# Altium project EVLSERVO1_control_v2.PrjPcb (part 1 of 9)
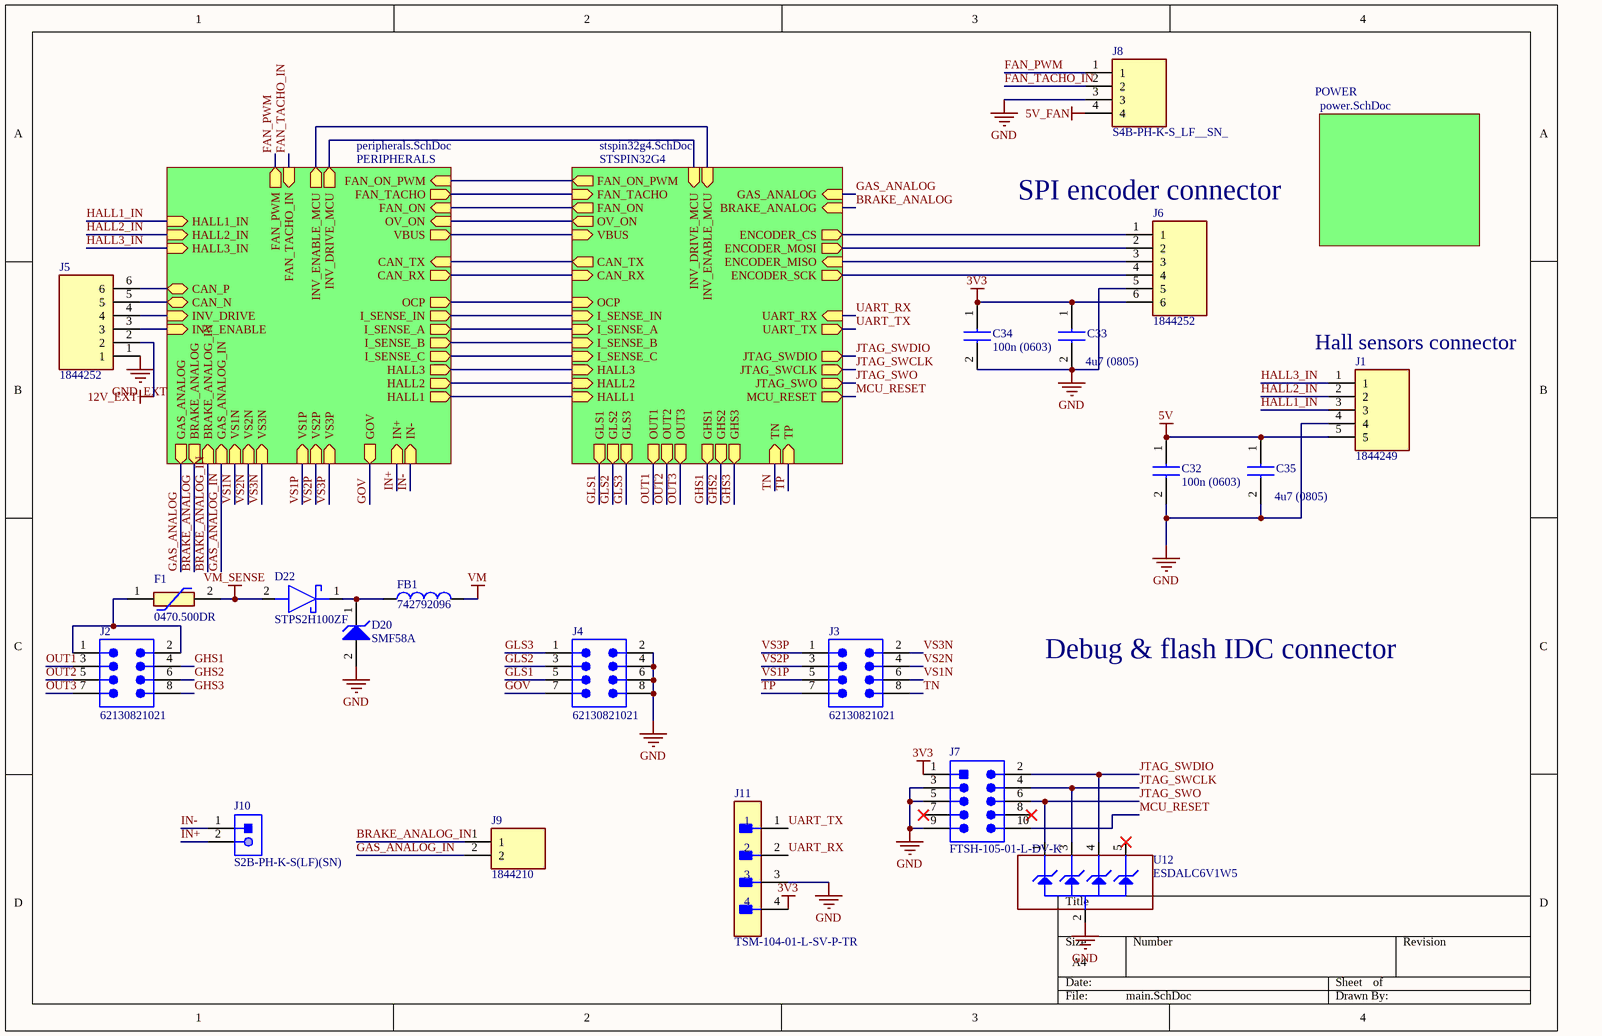
[diagram p0: main.SchDoc]
4 sheets, 223 parts. Net scope: hierarchical (ports join the sheet entries above them; power ports are global).
Board file: PCB1.PcbDoc
Sheets:
  main.SchDoc
    PERIPHERALS = peripherals.SchDoc
    POWER = power.SchDoc
    STSPIN32G4 = stspin32g4.SchDoc

## Sheet main.SchDoc
size A4; SheetNumber: 1; SheetTotal: 4

### Parts
C32  100n (0603)  [C0603]
C33  4u7 (0805)  [C0805]
C34  100n (0603)  [C0603]
C35  4u7 (0805)  [C0805]
D20  SMF58A  [ONSC-SOD-123FL-2-498_V]
D22  STPS2H100ZF  [SODFL3516X110N]
F1  0470.500DR  [1206L075132WR]
FB1  742792096  [WE-CBF_0805_L2W1.2H0.9_HC]
J1  1844249  [SHDRRA5W80P0X350_1X5_1890X920X825P]
J2  62130821021  [62130821021]
J3  62130821021  [62130821021]
J4  62130821021  [62130821021]
J5  1844252  [SHDRRA6W83P0X350_1X6_2240X920X825P]
J6  1844252  [SHDRRA6W83P0X350_1X6_2240X920X825P]
J7  FTSH-105-01-L-DV-K  [SMTC-FTSH-105-01-L-DV-K_V]
J8  S4B-PH-K-S_LF__SN_  [SHDRRA4W50P0X200_1X4_990X760X480P]
J9  1844210  [SHDRRA2W80P0X350_1X2_840X920X825P]
J10  S2B-PH-K-S(LF)(SN)  [JST-S2B-PH-K-S_V]
J11  TSM-104-01-L-SV-P-TR  [FP-TSM-104-01-L-SV-P-TR-MFG]
U12  ESDALC6V1W5  [ESDALC6V1W5]

### Sub-sheets
PERIPHERALS = peripherals.SchDoc: CAN_TX (in), CAN_RX (out), CAN_P (bidir), CAN_N (bidir), VS3N (in), VS2N (in), VS1N (in), VS1P (in), VS2P (in), VS3P (in), I_SENSE_A (out), I_SENSE_B (out), I_SENSE_C (out), I_SENSE_IN (out), OCP (out), VBUS (out), HALL1_IN (in), HALL2_IN (in), HALL3_IN (in), HALL1 (out), HALL2 (out), HALL3 (out), GOV (out), OV_ON (in), FAN_PWM (out), FAN_ON (in), FAN_ON_PWM (in), FAN_TACHO (out), FAN_TACHO_IN (in), IN- (in), IN+ (in), INV_DRIVE (in), INV_ENABLE (in), INV_DRIVE_MCU (out), INV_ENABLE_MCU (out), GAS_ANALOG (out), BRAKE_ANALOG (out), BRAKE_ANALOG_IN (in), GAS_ANALOG_IN (in)
POWER = power.SchDoc: no entries
STSPIN32G4 = stspin32g4.SchDoc: CAN_TX (out), CAN_RX (in), GHS1 (out), GHS2 (out), GHS3 (out), GLS3 (out), GLS2 (out), GLS1 (out), OUT1 (out), OUT2 (out), OUT3 (out), I_SENSE_A (in), I_SENSE_B (in), I_SENSE_C (in), OCP (in), VBUS (in), HALL3 (in), HALL2 (in), HALL1 (in), TN (in), TP (in), MCU_RESET (out), ENCODER_CS (out), ENCODER_SCK (out), ENCODER_MISO (in), ENCODER_MOSI (out), JTAG_SWDIO (out), JTAG_SWCLK (out), JTAG_SWO (out), UART_RX (in), UART_TX (out), I_SENSE_IN (in), OV_ON (out), GAS_ANALOG (in), BRAKE_ANALOG (in), FAN_ON_PWM (out), FAN_TACHO (in), FAN_ON (out), INV_DRIVE_MCU (in), INV_ENABLE_MCU (in)

### Nets
3V3: C33.1 C34.1 J6.6 J7.1 J11.4
5V: C32.1 C35.1 J1.5
5V_FAN: J8.4
12V_EXT: J5.2
GND: C32.2 C33.2 C34.2 C35.2 D20.2(A) J1.4 J4.2 J4.4 J4.6 J4.8 J6.5 J7.3 J7.5 J7.9 J8.3 J11.3 U12.2(GND)
GND_EXT: J5.1
VM: FB1.2
VM_SENSE: D22.2(A) F1.2
BRAKE_ANALOG: sheet PERIPHERALS/BRAKE_ANALOG, sheet STSPIN32G4/BRAKE_ANALOG
BRAKE_ANALOG_IN: J9.1 ; sheet PERIPHERALS/BRAKE_ANALOG_IN
CAN_N: J5.5 ; sheet PERIPHERALS/CAN_N
CAN_P: J5.6 ; sheet PERIPHERALS/CAN_P
CAN_RX: sheet PERIPHERALS/CAN_RX, sheet STSPIN32G4/CAN_RX
CAN_TX: sheet PERIPHERALS/CAN_TX, sheet STSPIN32G4/CAN_TX
ENCODER_CS: J6.1 ; sheet STSPIN32G4/ENCODER_CS
ENCODER_MISO: J6.3 ; sheet STSPIN32G4/ENCODER_MISO
ENCODER_MOSI: J6.2 ; sheet STSPIN32G4/ENCODER_MOSI
ENCODER_SCK: J6.4 ; sheet STSPIN32G4/ENCODER_SCK
FAN_ON: sheet PERIPHERALS/FAN_ON, sheet STSPIN32G4/FAN_ON
FAN_PWM: J8.1 ; sheet PERIPHERALS/FAN_PWM
FAN_PWM_ON: sheet PERIPHERALS/FAN_ON_PWM, sheet STSPIN32G4/FAN_ON_PWM
FAN_TACHO: sheet PERIPHERALS/FAN_TACHO, sheet STSPIN32G4/FAN_TACHO
FAN_TACHO_IN: J8.2 ; sheet PERIPHERALS/FAN_TACHO_IN
GAS_ANALOG: sheet PERIPHERALS/GAS_ANALOG, sheet STSPIN32G4/GAS_ANALOG
GAS_ANALOG_IN: J9.2 ; sheet PERIPHERALS/GAS_ANALOG_IN
GHS1: J2.4 ; sheet STSPIN32G4/GHS1
GHS2: J2.6 ; sheet STSPIN32G4/GHS2
GHS3: J2.8 ; sheet STSPIN32G4/GHS3
GLS1: J4.5 ; sheet STSPIN32G4/GLS1
GLS2: J4.3 ; sheet STSPIN32G4/GLS2
GLS3: J4.1 ; sheet STSPIN32G4/GLS3
GOV: J4.7 ; sheet PERIPHERALS/GOV
HALL1_IN: J1.3 ; sheet PERIPHERALS/HALL1_IN
HALL2_IN: J1.2 ; sheet PERIPHERALS/HALL2_IN
HALL3_IN: J1.1 ; sheet PERIPHERALS/HALL3_IN
I_SENSE_A: sheet PERIPHERALS/I_SENSE_A, sheet STSPIN32G4/I_SENSE_A
I_SENSE_B: sheet PERIPHERALS/I_SENSE_B, sheet STSPIN32G4/I_SENSE_B
I_SENSE_C: sheet PERIPHERALS/I_SENSE_C, sheet STSPIN32G4/I_SENSE_C
IN+: J10.2 ; sheet PERIPHERALS/IN+  [project net IIN+]
IN-: J10.1 ; sheet PERIPHERALS/IN-  [project net IIN-]
INV_DRIVE_MCU: sheet PERIPHERALS/INV_DRIVE_MCU, sheet STSPIN32G4/INV_DRIVE_MCU
INV_ENABLE_MCU: sheet PERIPHERALS/INV_ENABLE_MCU, sheet STSPIN32G4/INV_ENABLE_MCU
JTAG_SWCLK: J7.4 U12.3(IO2) ; sheet STSPIN32G4/JTAG_SWCLK
JTAG_SWDIO: J7.2 U12.4(IO3) ; sheet STSPIN32G4/JTAG_SWDIO
JTAG_SWO: J7.6 U12.1(IO1) ; sheet STSPIN32G4/JTAG_SWO
MCU_RESET: J7.10 ; sheet STSPIN32G4/MCU_RESET
OCP: sheet PERIPHERALS/OCP, sheet STSPIN32G4/OCP
OUT1: J2.3 ; sheet STSPIN32G4/OUT1
OUT2: J2.5 ; sheet STSPIN32G4/OUT2
OUT3: J2.7 ; sheet STSPIN32G4/OUT3
OV_ON: sheet PERIPHERALS/OV_ON, sheet STSPIN32G4/OV_ON
TN: J3.8 ; sheet STSPIN32G4/TN  [project net NTC]
TP: J3.7 ; sheet STSPIN32G4/TP
UART_RX: J11.2 ; sheet STSPIN32G4/UART_RX
UART_TX: J11.1 ; sheet STSPIN32G4/UART_TX
VBUS: sheet PERIPHERALS/VBUS, sheet STSPIN32G4/VBUS
VS1N: J3.6 ; sheet PERIPHERALS/VS1N
VS1P: J3.5 ; sheet PERIPHERALS/VS1P
VS2N: J3.4 ; sheet PERIPHERALS/VS2N
VS2P: J3.3 ; sheet PERIPHERALS/VS2P
VS3N: J3.2 ; sheet PERIPHERALS/VS3N
VS3P: J3.1 ; sheet PERIPHERALS/VS3P
NetC29_2: sheet PERIPHERALS/I_SENSE_IN, sheet STSPIN32G4/I_SENSE_IN
NetC42_2: sheet PERIPHERALS/HALL1, sheet STSPIN32G4/HALL1
NetC43_2: sheet PERIPHERALS/HALL2, sheet STSPIN32G4/HALL2
NetC44_2: sheet PERIPHERALS/HALL3, sheet STSPIN32G4/HALL3
NetD20_1: D20.1(K) D22.1(K) FB1.1
NetF1_1: F1.1 J2.1 J2.2
NetJ5_3: J5.3 ; sheet PERIPHERALS/INV_ENABLE
NetJ5_4: J5.4 ; sheet PERIPHERALS/INV_DRIVE

Not connected (* = marked no-connect by the designer): J7 7* 8*; U12 5(IO4)*

### Notes on the sheet
- (near J6) SPI encoder connector
- (near J1) Hall sensors connector
- Debug & flash IDC connector

### Library data of the parts
C32 C34 = GCM188R71E104JA57D: CAP CER 0.1UF 25V X7R 0603 / 0.1 μF ±5% 25V Ceramic Capacitor X7R 0603 (1608 Metric); Manufacturer_Name: Murata Electronics; Manufacturer: Murata; Manufacturer Lifecycle Status: NRND; Value: 100nF; Datasheet Link: https://search.murata.co.jp/Ceramy/image/img/A01X/G101/ENG/GCM188R71E104JA57-01A.pdf; Height: 0.9mm; Manufacturer_Part_Number: GCM188R71E104JA57D; Mouser Part Number: 81-GCM188R71E104JAD; Mouser Price/Stock: https://www.mouser.co.uk/ProductDetail/Murata-Electronics/GCM188R71E104JA57D?qs=ui%252B2d9lVEI5lLkZDVYlCng%3D%3D; Arrow Part Number: GCM188R71E104JA57D; Arrow Price/Stock: https://www.arrow.com/en/products/gcm188r71e104ja57d/murata-manufacturing; Supplier: DigiKey; Supplier Part Number: 490-GCM188R71E104JA57DCT-ND; Manufacturer Part Number: GCM188R71E104JA57D; RoHS: Compliant; Category: Ceramic Capacitors; Stock: 2875; Pricing: 1=0,33, 10=0,196, 50=0,1434, 100=0,1272, 500=0,09986, 1000=0,09143 (USD); Case/Package: 0603; Country of Origin: Philippines; Dielectric Material: Ceramic; Export Control Classification Number (ECCN) Code: EAR99; Harmonized Tariff Schedule (HTS) Code: 8532.24.00.20; Introduction Date: 2013-11-20; Length: 1.6mm; Lifecycle Status: NRND; Max Operating Temperature: 125°C; Min Operating Temperature: -55°C; Mounting Technology: Surface Mount; Number of Terminals: 2; Ratings: AEC-Q200; REACH SVHC: Yes; Schedule B: 8532240020, 8532240020|8532240020|8532240020|8532240020|8532240020; Thickness: 800µm; Voltage Rating (DC): 25V; Width: 800µm; ComponentLink1URL: https://datasheet.octopart.com:443/GCM188R71E104JA57D-Murata-datasheet-141267551.pdf?src-supplier=Geoflip; ComponentLink1Description: https://datasheet.octopart.com:443/GCM188R71E104JA57D-Murata-datasheet-141267551.pdf?src-supplier=Geoflip; ComponentLink2URL: https://datasheet.octopart.com:443/GCM188R71E104JA57D-Murata-datasheet-140658663.pdf?src-supplier=Ciiva; ComponentLink2Description: https://datasheet.octopart.com:443/GCM188R71E104JA57D-Murata-datasheet-140658663.pdf?src-supplier=Ciiva; ComponentLink3URL: https://datasheet.octopart.com:443/GCM188R71E104JA57D-Murata-datasheet-138718229.pdf?src-supplier=Ciiva; ComponentLink3Description: https://datasheet.octopart.com:443/GCM188R71E104JA57D-Murata-datasheet-138718229.pdf?src-supplier=Ciiva; ComponentLink4URL: http://sigma.octopart.com:80/reach_statement/Murata-company-16.pdf?src-supplier=Compliance+Statements; ComponentLink4Description: http://sigma.octopart.com:80/reach_statement/Murata-company-16.pdf?src-supplier=Compliance+Statements
C33 C35 = GRM21BZ71E475KE15L: 25V 4.7uF X7R ±10% 0805 Multilayer Ceramic Capacitors MLCC - SMD/SMT ROHS; Manufacturer_Name: Murata Electronics; Manufacturer: Murata; Manufacturer Lifecycle Status: IN PRODUCTION; Value: 4.7µF; Datasheet Link: https://search.murata.co.jp/Ceramy/image/img/A01X/G101/ENG/GRM21BZ71E475KE15-01A.pdf; Height: 1.45mm; Manufacturer_Part_Number: GRM21BZ71E475KE15L; Mouser Part Number: 81-GRM21BZ71E475KE5L; Mouser Price/Stock: https://www.mouser.co.uk/ProductDetail/Murata-Electronics/GRM21BZ71E475KE15L?qs=Ey7%2FXF42M3feXnDNgc%252BFlQ%3D%3D; Arrow Part Number: GRM21BZ71E475KE15L; Arrow Price/Stock: https://www.arrow.com/en/products/grm21bz71e475ke15l/murata-manufacturing?utm_currency=USD&region=nac; Supplier: RS; Supplier Part Number: 2478136; Manufacturer Part Number: GRM21BZ71E475KE15L; RoHS: Compliant; Category: Ceramic Capacitors; Stock: 4700; Case/Package: 0805; Dielectric Material: Ceramic; Export Control Classification Number (ECCN) Code: EAR99; Harmonized Tariff Schedule (HTS) Code: 8532.24.00.20; Introduction Date: 2017-02-22; Length: 2mm; Lifecycle Status: Production; Material: Ceramic; Max Operating Temperature: 125°C; Min Operating Temperature: -55°C; Mounting Technology: Surface Mount; Number of Terminals: 2; REACH SVHC: Yes; Thickness: 1.25mm; Tolerance: 10%; Voltage Rating: 25V; Voltage Rating (DC): 25V; Width: 1.25mm; ComponentLink1URL: https://datasheet.octopart.com:443/GRM21BZ71E475KE15L-Murata-datasheet-155345087.pdf?src-supplier=Newark; ComponentLink1Description: https://datasheet.octopart.com:443/GRM21BZ71E475KE15L-Murata-datasheet-155345087.pdf?src-supplier=Newark; ComponentLink2URL: https://datasheet.octopart.com:443/GRM21BZ71E475KE15L-Murata-datasheet-141278877.pdf?src-supplier=Geoflip; ComponentLink2Description: https://datasheet.octopart.com:443/GRM21BZ71E475KE15L-Murata-datasheet-141278877.pdf?src-supplier=Geoflip; ComponentLink3URL: https://datasheet.octopart.com:443/GRM21BZ71E475KE15L-Murata-datasheet-165579666.pdf?src-supplier=TME; ComponentLink3Description: https://datasheet.octopart.com:443/GRM21BZ71E475KE15L-Murata-datasheet-165579666.pdf?src-supplier=TME; ComponentLink4URL: https://datasheet.octopart.com:443/GRM21BZ71E475KE15L-Murata-datasheet-140707839.pdf?src-supplier=Ciiva; ComponentLink4Description: https://datasheet.octopart.com:443/GRM21BZ71E475KE15L-Murata-datasheet-140707839.pdf?src-supplier=Ciiva; ComponentLink5URL: https://datasheet.octopart.com:443/GRM21BZ71E475KE15L-Murata-datasheet-138745135.pdf?src-supplier=Ciiva; ComponentLink5Description: https://datasheet.octopart.com:443/GRM21BZ71E475KE15L-Murata-datasheet-138745135.pdf?src-supplier=Ciiva; ComponentLink6URL: http://sigma.octopart.com:80/reach_statement/Murata-company-16.pdf?src-supplier=Compliance+Statements; ComponentLink6Description: http://sigma.octopart.com:80/reach_statement/Murata-company-16.pdf?src-supplier=Compliance+Statements
D20 = CMP-1061-00608-1: 200 W Transient Voltage Suppressor, 2-Pin SOD-123FL, Pb-Free, Tape and Reel; Manufacturer: On Semiconductor; PartNumber: SMF58AT1G; Direction: Unidirectional; IR Max (uA): 1; V(BR) Typ (V): 67.8; ComponentLink2URL: http://www.onsemi.com/pub_link/Collateral/SMF5.0AT1-D.PDF; Packing: Tape and Reel; DatasheetVersion: Rev. 7; PackageReference: SOD-123FL-2-498; ComponentLink2Description: Datasheet; RoHS: Pb-Free; ComponentLink3Description: Package Specification; PackageVersion: Rev. D, 05/2013; ComponentLink1URL: http://www.onsemi.com/; ComponentLink3URL: http://www.onsemi.com/pub_link/Collateral/498-01.PDF; PackageDescription: 2-Pin SOD, Body 1.65 x 2.7 mm; Mounting Technology: Surface Mount; ComponentLink1Description: Manufacturer URL
D22 = STPS2H100ZF: Schottky Diode; Manufacturer_Name: STMicroelectronics; Datasheet Link: https://www.st.com/resource/en/datasheet/stps2h100zf.pdf; Height: 1.1mm; Manufacturer_Part_Number: STPS2H100ZF; Mouser Part Number: 511-STPS2H100ZF; Mouser Price/Stock: https://www.mouser.co.uk/ProductDetail/STMicroelectronics/STPS2H100ZF?qs=BAoXHaCe4Em%2FfzC%252BFY2Wew%3D%3D; Arrow Part Number: STPS2H100ZF; Arrow Price/Stock: https://www.arrow.com/en/products/stps2h100zf/stmicroelectronics?utm_currency=USD&region=nac
F1 = 1206L110_16WR: Resettable Fuse; Manufacturer_Name: LITTELFUSE; Manufacturer_Part_Number: 1206L110/16WR; Datasheet Link: https://www.littelfuse.com/~/media/electronics/datasheets/resettable_ptcs/littelfuse_ptc_1206l_datasheet.pdf.pdf; Height: 1.25mm; Mouser Part Number: 576-1206L110/16WR; Mouser Price/Stock: https://www.mouser.co.uk/ProductDetail/Littelfuse/1206L110-16WR?qs=TVaBpCI%2FeOi62RF5AFEWSA%3D%3D; Arrow Part Number: 1206L110/16WR; Arrow Price/Stock: https://www.arrow.com/en/products/1206l11016wr/littelfuse?utm_currency=USD&region=nac
FB1 = CMP-0220-00166-2: NexarPartId: 8916991; Impedance: 1kΩ; Inductance: 2.2H; Current Rating: 1A; Tolerance: 25%; Resistance: 300mΩ; Number of Lines: 1; Test Frequency: 100MHz; Termination: SMD/SMT; REACH SVHC: Unknown; Depth: 1.2mm; Case Code (Imperial): 0805; Case/Package: SMD/SMT; RoHS: Compliant; Material: Ferrite; Max Current Rating: 1A; Width: 1.2mm; Packaging: Digi-Reel®; Lead Free: Lead Free; Height: 900µm; Core Material: Ferrite; Weight: 5.499807mg; Max DC Current: 1A; Min Operating Temperature: -55°C; Max Operating Temperature: 125°C; Mount: Surface Mount; Length: 2mm; Case Code (Metric): 2012; DC Resistance (DCR): 300mΩ
J1 = 1844249: Connector; Manufacturer_Name: Phoenix Contact; Datasheet Link: https://www.phoenixcontact.com/en-us/products/pcb-header-mc-15-5-g-35-1844249?type=pdf; Height: 8.25mm; Manufacturer_Part_Number: 1844249; Mouser Part Number: 651-1844249; Mouser Price/Stock: https://www.mouser.co.uk/ProductDetail/Phoenix-Contact/1844249?qs=wd%252Bw3mUqFrkyoPkI2iC2Lg%3D%3D; Arrow Part Number: 1844249; Arrow Price/Stock: https://www.arrow.com/en/products/1844249/phoenix-contact.html?utm_currency=USD&region=nac
J2-J4 = CMP-03913-122375878-3: Conn, Header, 8Pos, 2Row, 1.27Mm Rohs Compliant: Yes; Current Rating: 1A; Number of Contacts: 8; Voltage Rating: 100V; Max Operating Temperature: 105°C; Number of Rows: 2; RoHS: Compliant; Contact Material: Gold; Height: 6.4mm; Min Operating Temperature: -40°C
J5 J6 = 1844252: Connector; Manufacturer_Name: Phoenix Contact; Datasheet Link: https://www.phoenixcontact.com/en-us/products/pcb-header-mc-15-6-g-35-1844252?type=pdf; Height: 8.25mm; Manufacturer_Part_Number: 1844252; Mouser Part Number: 651-1844252; Mouser Price/Stock: https://www.mouser.co.uk/ProductDetail/Phoenix-Contact/1844252?qs=8BCRtFWWXOQ9wOLoIUfCgg%3D%3D; Arrow Part Number: 1844252; Arrow Price/Stock: https://www.arrow.com/en/products/1844252/phoenix-contact?utm_currency=USD&region=nac
J7 = CMP-2000-05353-1: Male Header, Pitch 1.27 mm, 2 x 5 Position, Height 6.25 mm; Manufacturer: Samtec; Pitch: 0.050"(1.27mm); Other Names: Q3937619; Number of Positions: 10; Mating Products: SFMC-105-L2-S-D-TR-ND / -CONN.05"SURFACE10POSSMT / FLE-105-01-G-DV-TR-ND / -CONNSKT1.27MM10POSDUALSMD / FLE-105-01-G-DV-A-P-ND / -CONNSKT1.27MM10POSDUALSMD / FLE-105-01-G-DV-A-ND / -CONNSKT1.27MM10POSDUALSMD / CLP-105-02-G-D-P-TR-ND / -CONNRCPT10POSDUAL.05"SMD / SAM1155-05-ND / -CONNRCPT10POSDUAL.05"SMD / SAM1154-05-ND / -CONNRCPT10POSDUAL.05"SMD / SAM1153-05-ND / -CONNRCPT10POSDUAL.05"SMD / SAM1226-05-ND / -CONNRCPT.05"10POSDUALSMD; Number of Positions Loaded: All; Connector Type: Header,Unshrouded; Product Training Modules: Board-to-BoardConnectors; Datasheet Version: Rev. ET, 10/1995; Number of Rows: 2; Standard Package: 1; Package Description: Male Header, Pitch 1.27 mm, 2 x 5 Position, Height 5.97 mm, Tail Length 4.32 mm; Contact Finish Thickness: 10µin(0.25µm); Series: FTSH; Termination: Solder; Contact Type: MalePin; Color: Black; Package Reference: FTSH-105-01-L-DV-K; Family: RectangularConnectors-Headers,MalePins; Package URL: http://suddendocs.samtec.com/prints/ftsh-1xx-xx-xxx-dv-xxx-footprint.pdf; Packaging: Tube; Mounting Type: SurfaceMount; Category: Connectors,Interconnects; Datasheet URL: http://suddendocs.samtec.com/prints/ftsh-1xx-xx-xxx-dv-xxx-mkt.pdf; Row Spacing: 0.050"(1.27mm); Manufacturer URL: http://www.samtec.com/; Contact Mating Length: 0.120"(3.05mm); Contact Finish: Gold
J8 = S4B-PH-K-S_LF__SN_: Connector; Manufacturer_Name: JST (JAPAN SOLDERLESS TERMINALS); Manufacturer_Part_Number: S4B-PH-K-S(LF)(SN); Datasheet Link: https://datasheet.lcsc.com/szlcsc/JST-Sales-America-PHsocket-1-4P-Curved-needle-pitch2mm_C157926.pdf; Height: 4.8mm; Mouser Part Number: N/A; Mouser Price/Stock: https://www.mouser.co.uk/ProductDetail/JST-Commercial/S4B-PH-K-SLFSN?qs=QpmGXVUTftEGA16rwNx4xw%3D%3D; Arrow Part Number: S4B-PH-K-S(LF)(SN); Arrow Price/Stock: https://www.arrow.com/en/products/s4b-ph-k-s-lf-sn/jst-manufacturing.html?utm_currency=USD&region=europe
J9 = 1844210: Connector; Manufacturer_Name: Phoenix Contact; Datasheet Link: https://www.phoenixcontact.com/en-us/products/pcb-header-mc-15-2-g-35-1844210?type=pdf; Height: 8.25mm; Manufacturer_Part_Number: 1844210; Mouser Part Number: 651-1844210; Mouser Price/Stock: https://www.mouser.co.uk/ProductDetail/Phoenix-Contact/1844210?qs=8BCRtFWWXORb3OQRdxIGVQ%3D%3D; Arrow Part Number: 1844210; Arrow Price/Stock: https://www.arrow.com/en/products/1844210/phoenix-contact?utm_currency=USD&region=nac
J10 = CMP-1755-00004-1: Male Header, Pitch 2 mm, 1 x 2 Position, Height 4.8 mm, Tail Length 3.4 mm, -25 to 85 degC, RoHS, Bulk; Case\Package: Radial; Tolerance: 20%; Capacitance: 10 uF; Voltage Rating (DC): 50 V; Packaging: Bulk; ComponentLink1URL: http://www.jst-mfg.com/product/pdf/eng/ePH.pdf; Radiation Hardening: No; Height: 11 mm; Package Quantity: 200; PackageDescription: Male Header, Pitch 2 mm, 1 x 2 Position, Height 4.8 mm, Tail Length 3.4 mm; PackageReference: S2B-PH-K-S; Diameter: 5 mm; Pins: 2; Mount: Through Hole; Max Operating Temperature: 85 degC; Min Operating Temperature: -40 degC; ComponentLink1Description: Datasheet; DatasheetVersion: Dec-12; Length: 11 mm; Lead Pitch: 2 mm; REACH SVHC: No SVHC; Voltage Rating: 50 V; RoHSCompliant: true
J11 = CMP-02766-000011-1: CONN HEADER SMD 4POS 2.54MM; Manufacturer: Samtec; Number Of Contacts: 4; Conn Gender: Male; Standoff Height: 0.04inch; Conn Orientation: Vertical; Current Rating: 5.4A; Voltage Rating: 475V; Manufacturer Part Number: TSM-104-01-L-SV-P-TR; Contact Material: Gold,Nickel; RoHS: TRUE; ComponentLink2URL: http://suddendocs.samtec.com/prints/tsm-1xx-xx-xxx-sv-xx-xxx-xx-mkt.pdf; Package: TSM-104-01-L-SV-P-TR; Lead Free: Yes; Automotive: No; Category: Conn; Digikey Description: CONN HEADER SMD 4POS 2.54MM; ComponentLink2Description: Datasheet; Temperature: -55°C to +125°C; Height: 0.403inch; Device Class L1: Connectors; Device Class L3: unset; Octopart: https://octopart.com/tsm-104-01-l-sv-p-tr-samtec-6805355; Pitch: 2.54mm; Footprint Url: http://suddendocs.samtec.com/prints/tsm-1xx-xx-xx-sv-xx-xxx-xx-footprint.pdf; Device Class L2: Headers and Wire Housings; Temperature Range Low: -55°C; Number Of Rows: 1; Temperature Range High: +125°C
U12 = ESDALC6V1W5: Dual Transil array for ESD protection; Internal_Part_Number: MCD-00136; Part_Type: Diode; Manufacturer: STMICROELECTRONICS; ECCN_US: EAR99; ECCN_EU: NEC; Provided_By: Subcon; Initial_Board_Reference: MB1262; Status: Released; Manufacturer_Part_Number: ESDALC6V1W5; ComponentLink1Description: STM_ESD_ESDALC6V1W5.pdf; ComponentLink1URL: http://tunmcdsvn.tun.st.com/Component_Datasheet_Library/Trunk/Diodes/STM_ESD_ESDALC6V1W5; Value: ESDALC6V1W5

## Sheet peripherals.SchDoc
size A2; SheetNumber: 3; SheetTotal: 4
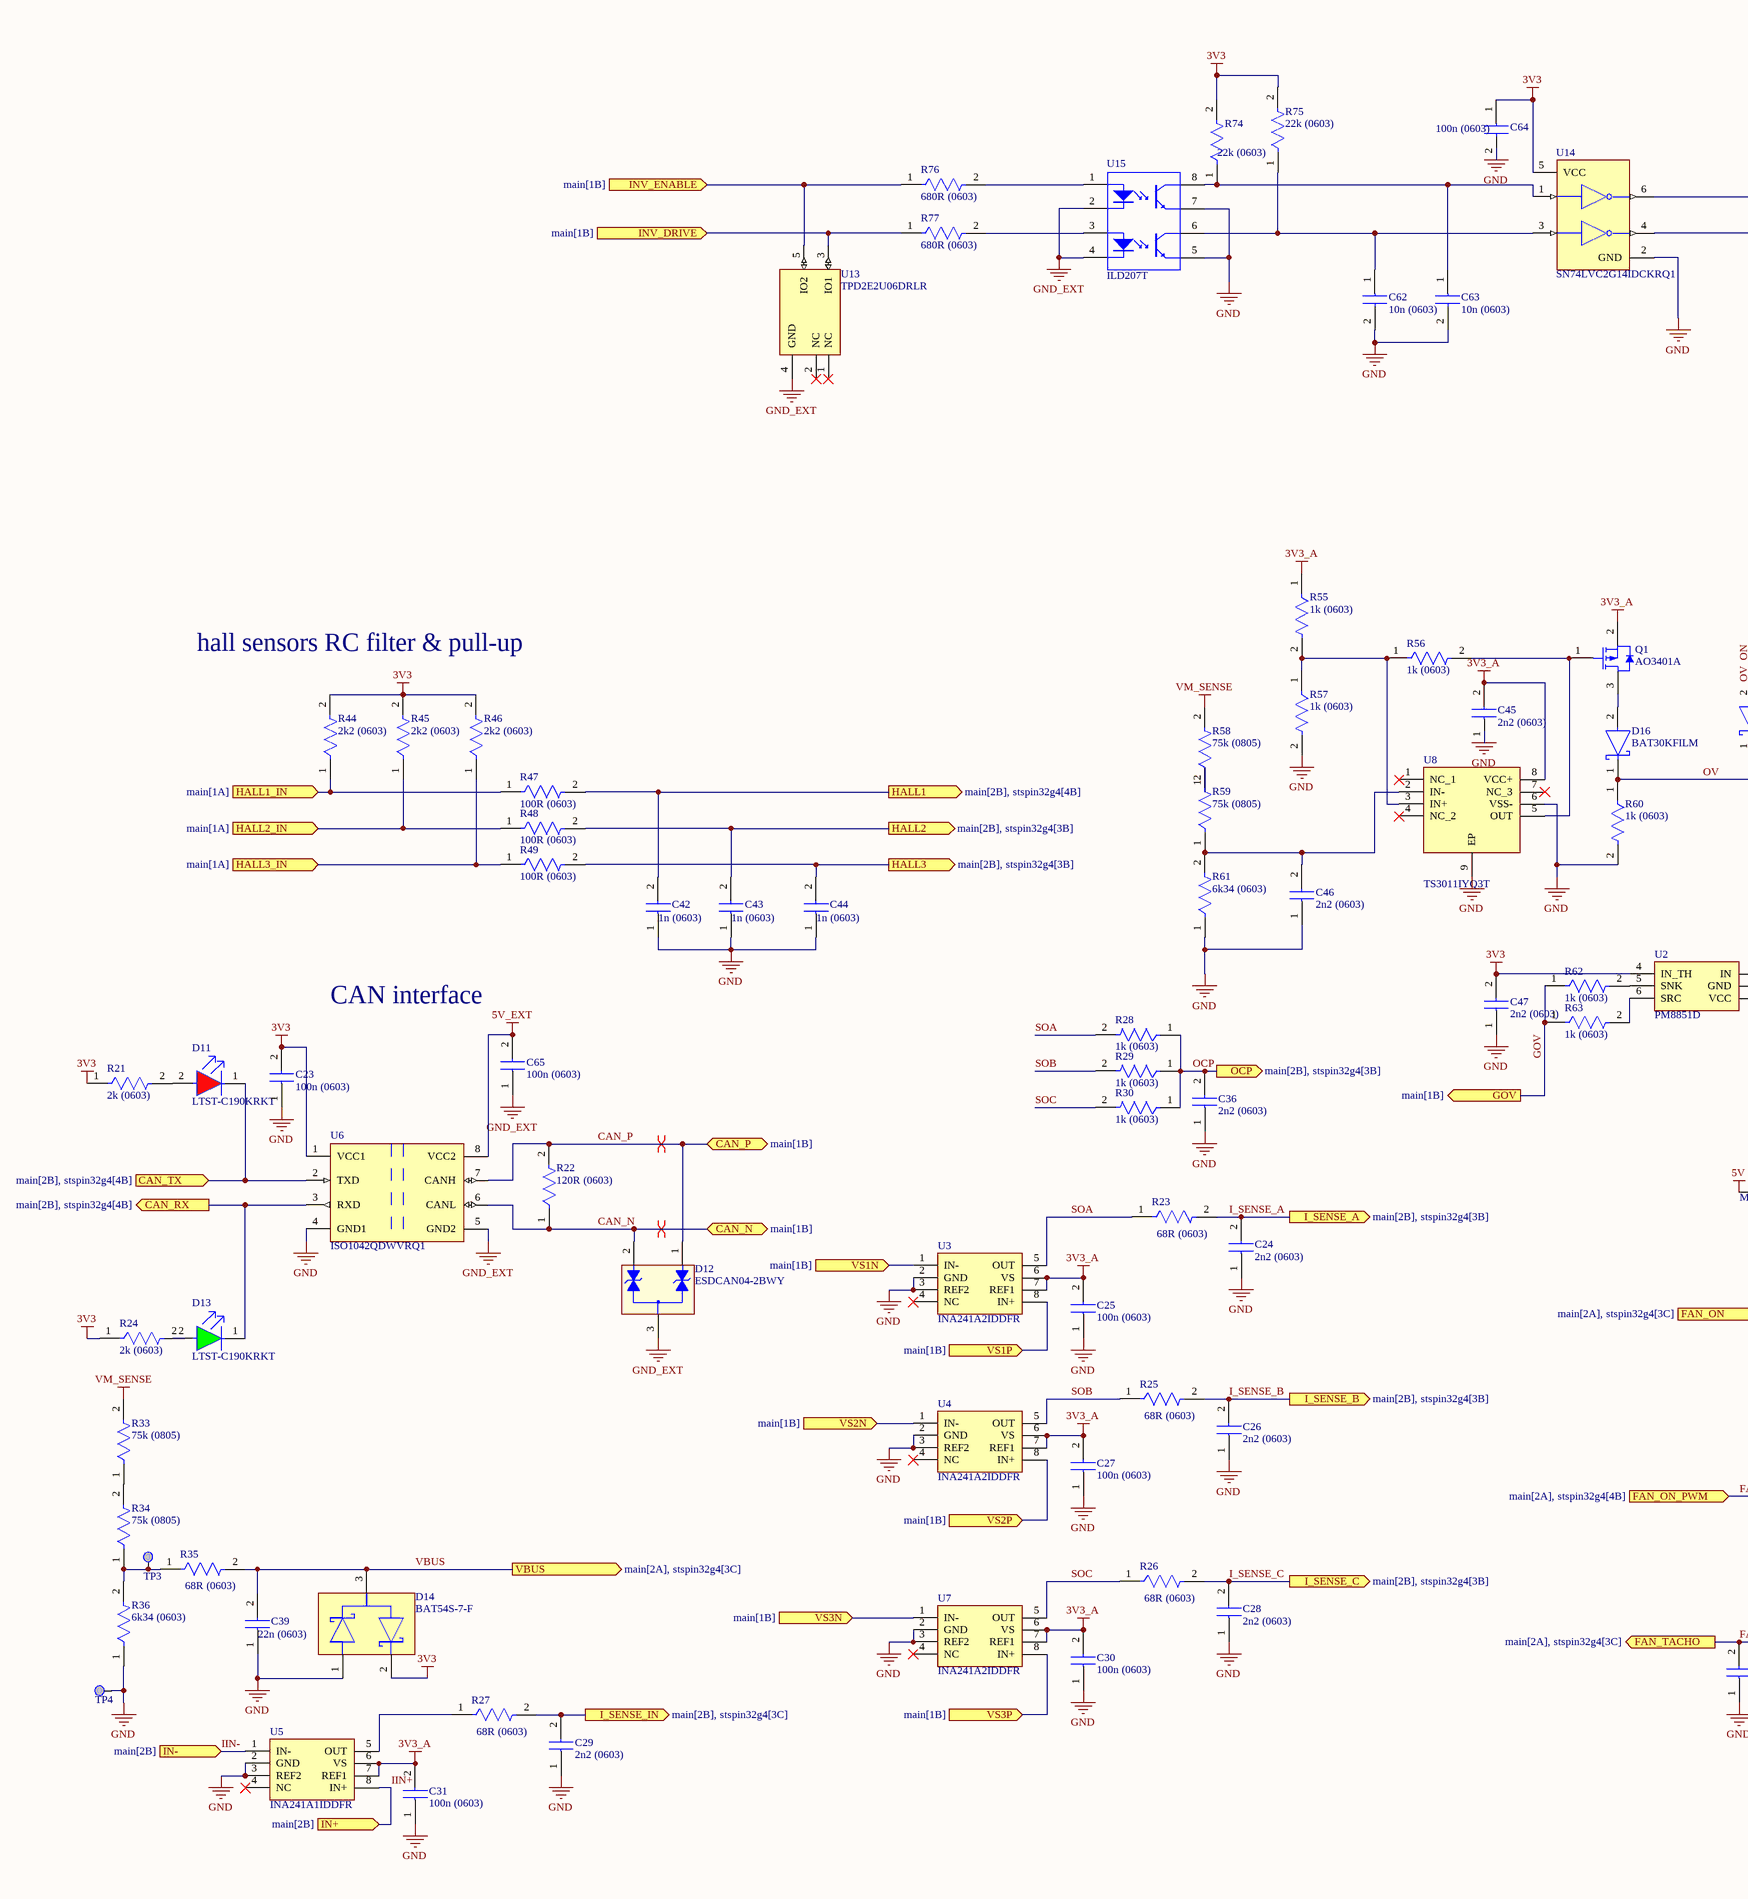
[diagram p1: peripherals.SchDoc, left]
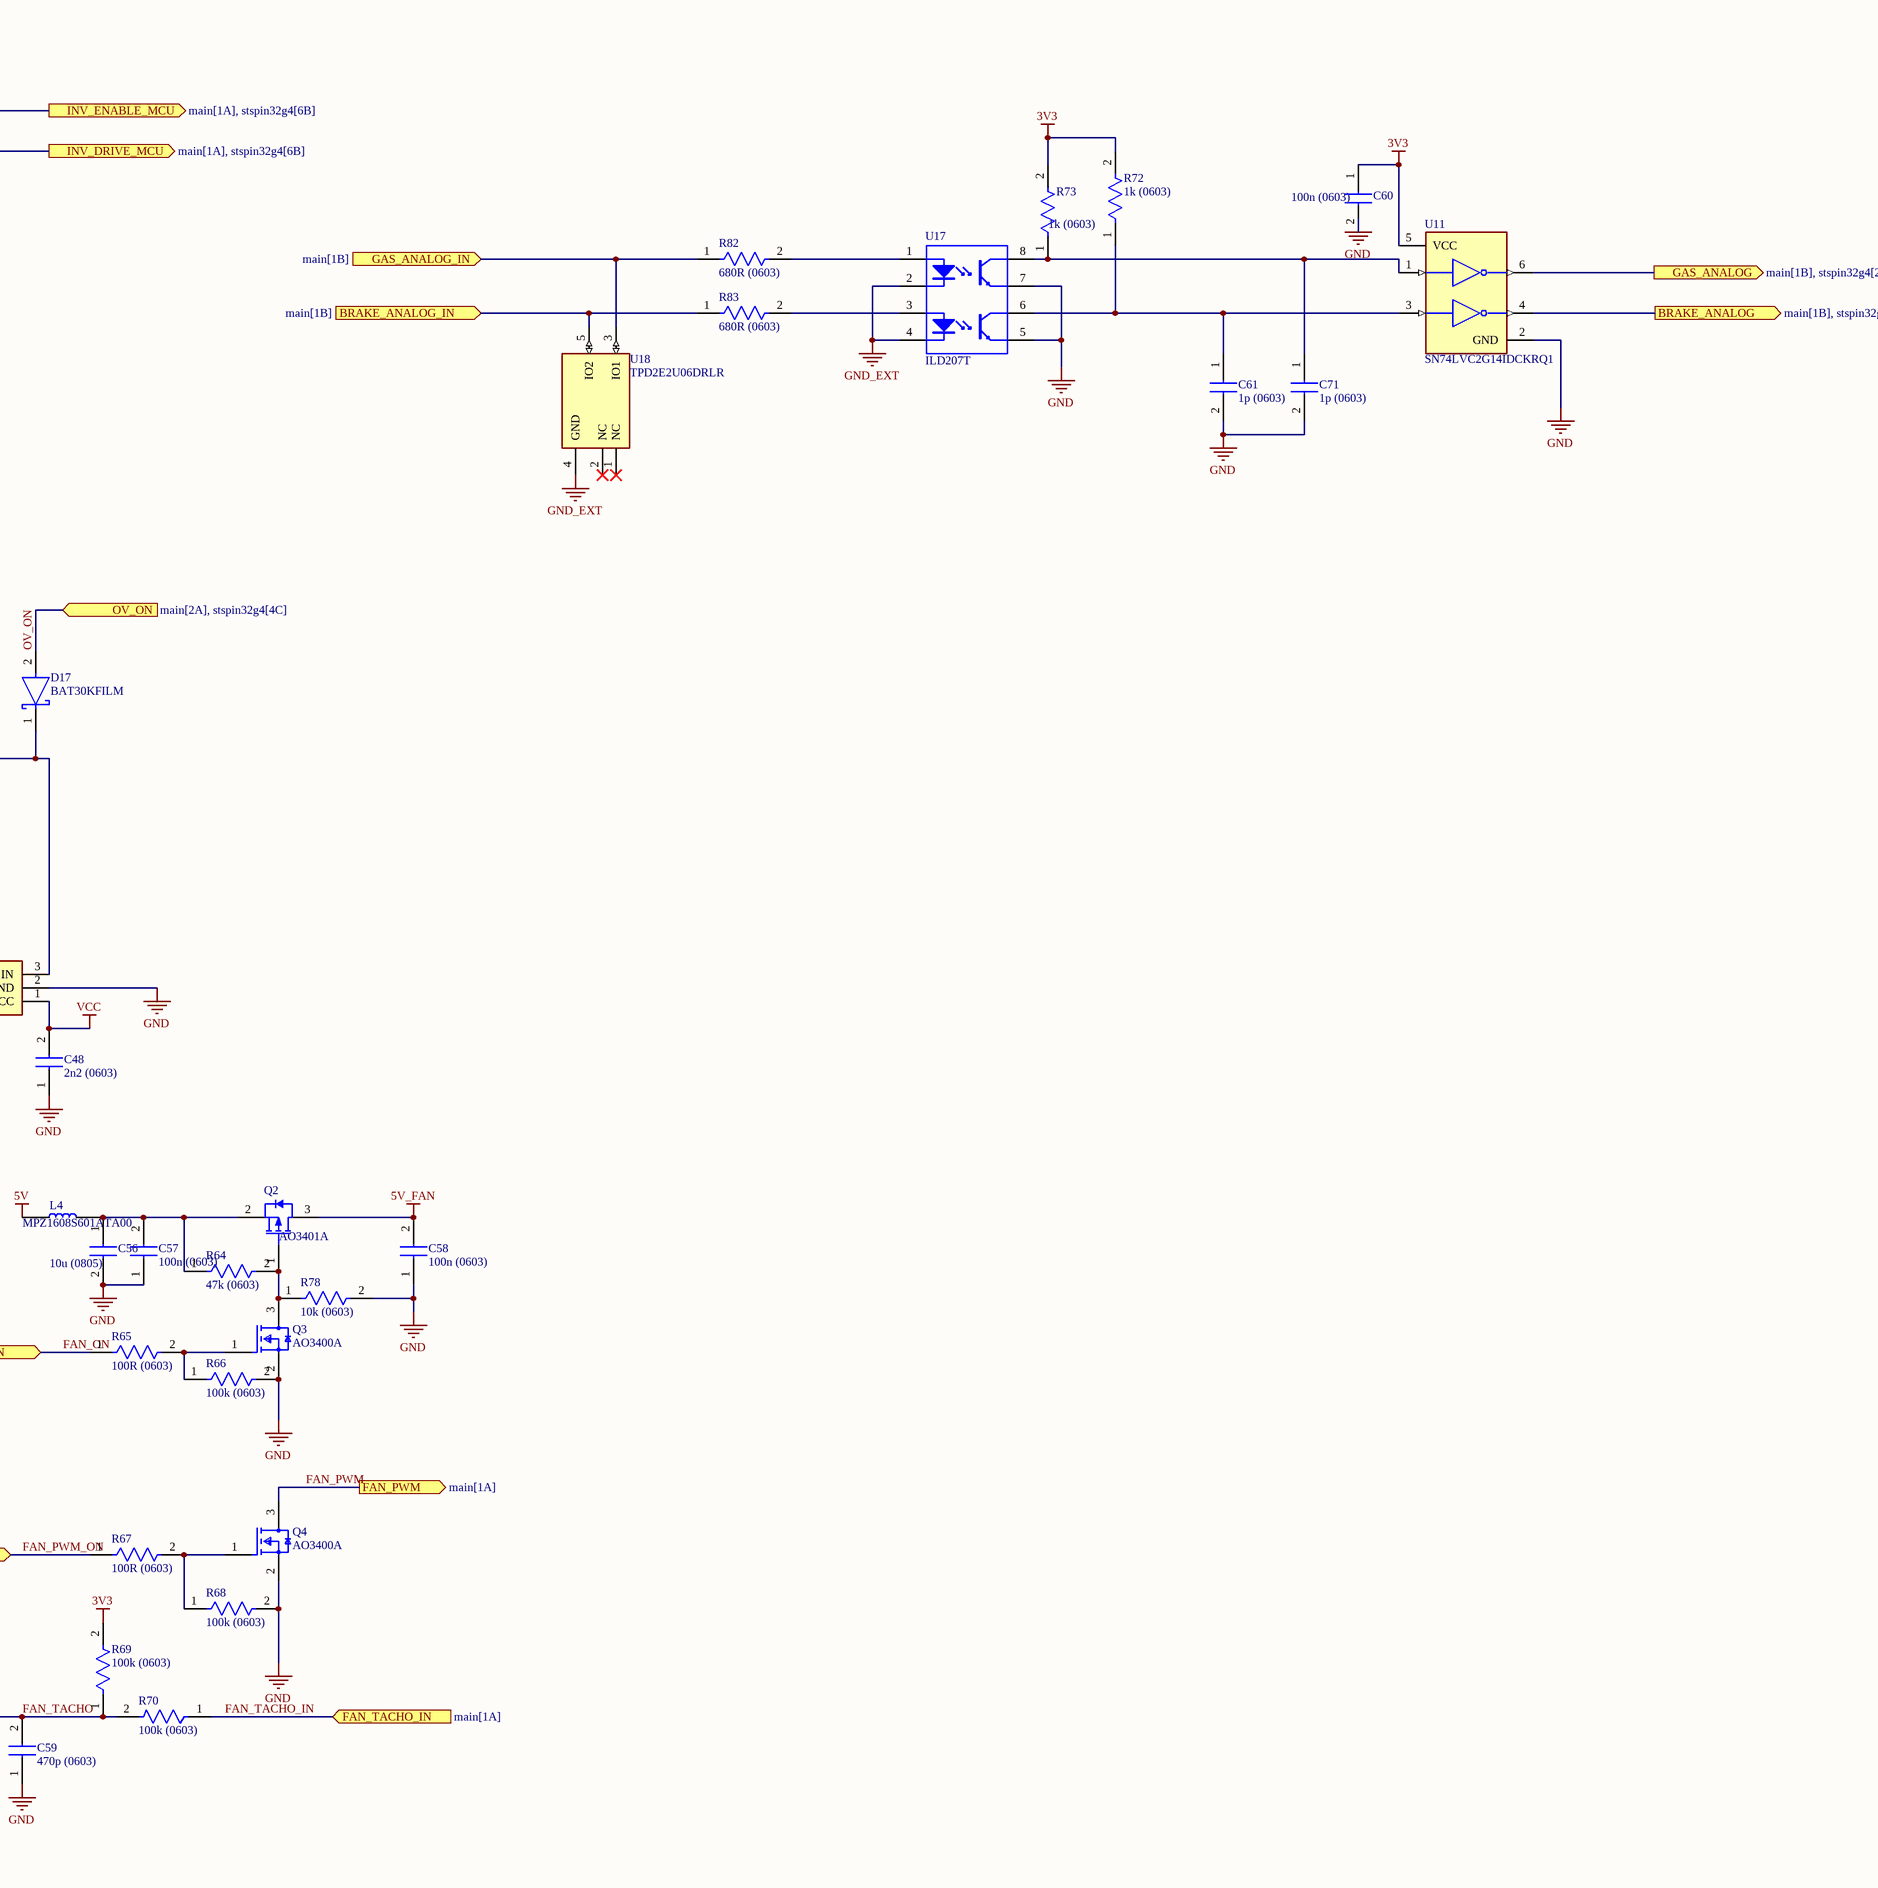
[diagram p2: peripherals.SchDoc, right]

### Parts
C23  100n (0603)  [C0603]
C24  2n2 (0603)  [C0603]
C25  100n (0603)  [C0603]
C26  2n2 (0603)  [C0603]
C27  100n (0603)  [C0603]
C28  2n2 (0603)  [C0603]
C29  2n2 (0603)  [C0603]
C30  100n (0603)  [C0603]
C31  100n (0603)  [C0603]
C36  2n2 (0603)  [C0603]
C39  22n (0603)  [C0603]
C42  1n (0603)  [C0603]
C43  1n (0603)  [C0603]
C44  1n (0603)  [C0603]
C45  2n2 (0603)  [C0603]
C46  2n2 (0603)  [C0603]
C47  2n2 (0603)  [C0603]
C48  2n2 (0603)  [C0603]
C56  10u (0805)  [C0805]
C57  100n (0603)  [C0603]
C58  100n (0603)  [C0603]
C59  470p (0603)  [C0603]
C60  100n (0603)  [C0603]
C61  1p (0603)  [C0603]
C62  10n (0603)  [C0603]
C63  10n (0603)  [C0603]
C64  100n (0603)  [C0603]
C65  100n (0603)  [C0603]
C71  1p (0603)  [C0603]
D11  LTST-C190KRKT  [FP-LTST-C190KRKT-MFG]
D12  ESDCAN04-2BWY  [SOT65P210X110-3N]
D13  LTST-C190KRKT  [FP-LTST-C190KRKT-MFG]
D14  BAT54S-7-F  [FP-SOT23-MFG]
D16  BAT30KFILM  [FP-SOD-523-IPC_C]
D17  BAT30KFILM  [FP-SOD-523-IPC_C]
L4  MPZ1608S601ATA00  [INDC1608X95N]
Q1  AO3401A  [AO-SOT-23-3L_V]
Q2  AO3401A  [AO-SOT-23-3L_V]
Q3  AO3400A  [FP-SOT23-MFG]
Q4  AO3400A  [FP-SOT23-MFG]
R21  2k (0603)  [R0603]
R22  120R (0603)  [R0603]
R23  68R (0603)  [R0603]
R24  2k (0603)  [R0603]
R25  68R (0603)  [R0603]
R26  68R (0603)  [R0603]
R27  68R (0603)  [R0603]
R28  1k (0603)  [R0603]
R29  1k (0603)  [R0603]
R30  1k (0603)  [R0603]
R33  75k (0805)  [R0805]
R34  75k (0805)  [R0805]
R35  68R (0603)  [R0603]
R36  6k34 (0603)  [R0603]
R44  2k2 (0603)  [R0603]
R45  2k2 (0603)  [R0603]
R46  2k2 (0603)  [R0603]
R47  100R (0603)  [R0603]
R48  100R (0603)  [R0603]
R49  100R (0603)  [R0603]
R55  1k (0603)  [R0603]
R56  1k (0603)  [R0603]
R57  1k (0603)  [R0603]
R58  75k (0805)  [R0805]
R59  75k (0805)  [R0805]
R60  1k (0603)  [R0603]
R61  6k34 (0603)  [R0603]
R62  1k (0603)  [R0603]
R63  1k (0603)  [R0603]
R64  47k (0603)  [R0603]
R65  100R (0603)  [R0603]
R66  100k (0603)  [R0603]
R67  100R (0603)  [R0603]
R68  100k (0603)  [R0603]
R69  100k (0603)  [R0603]
R70  100k (0603)  [R0603]
R72  1k (0603)  [R0603]
R73  1k (0603)  [R0603]
R74  22k (0603)  [R0603]
R75  22k (0603)  [R0603]
R76  680R (0603)  [R0603]
R77  680R (0603)  [R0603]
R78  10k (0603)  [R0603]
R82  680R (0603)  [R0603]
R83  680R (0603)  [R0603]
TP3  TP  [Test_Point_45]  (value not drawn)
TP4  TP  [Test_Point_50]  (value not drawn)
U2  PM8851D  [SOT95P280X145-6N]
U3  INA241A2IDDFR  [SOT65P280X110-8N]
U4  INA241A2IDDFR  [SOT65P280X110-8N]
U5  INA241A1IDDFR  [SOT65P280X110-8N]
U6  ISO1042QDWVRQ1  [FP-DWV0008A-IPC_C]
U7  INA241A2IDDFR  [SOT65P280X110-8N]
U8  TS3011IYQ3T  [SON50P200X200X80-9N]
U11  SN74LVC2G14IDCKRQ1  [FP-DCK0006A-IPC_C]
U13  TPD2E2U06DRLR  [FP-DRL0005A-MFG]
U14  SN74LVC2G14IDCKRQ1  [FP-DCK0006A-IPC_C]
U15  ILD207T  [VISH-SOIC-8_C_V]
U17  ILD207T  [VISH-SOIC-8_C_V]
U18  TPD2E2U06DRLR  [FP-DRL0005A-MFG]

### Ports
BRAKE_ANALOG (out, see main[1B], stspin32g4[3C]), BRAKE_ANALOG_IN (in, see main[1B]), CAN_N (bidir, see main[1B]), CAN_P (bidir, see main[1B]), CAN_RX (out, see main[2B], stspin32g4[4B]), CAN_TX (in, see main[2B], stspin32g4[4B]), FAN_ON (in, see main[2A], stspin32g4[3C]), FAN_ON_PWM (in, see main[2A], stspin32g4[4B]), FAN_PWM (out, see main[1A]), FAN_TACHO (out, see main[2A], stspin32g4[3C]), FAN_TACHO_IN (in, see main[1A]), GAS_ANALOG (out, see main[1B], stspin32g4[2C]), GAS_ANALOG_IN (in, see main[1B]), GOV (out, see main[1B]), HALL1 (out, see main[2B], stspin32g4[4B]), HALL1_IN (in, see main[1A]), HALL2 (out, see main[2B], stspin32g4[3B]), HALL2_IN (in, see main[1A]), HALL3 (out, see main[2B], stspin32g4[3B]), HALL3_IN (in, see main[1A]), I_SENSE_A (out, see main[2B], stspin32g4[3B]), I_SENSE_B (out, see main[2B], stspin32g4[3B]), I_SENSE_C (out, see main[2B], stspin32g4[3B]), I_SENSE_IN (out, see main[2B], stspin32g4[3C]), IN+ (in, see main[2B]), IN- (in, see main[2B]), INV_DRIVE (in, see main[1B]), INV_DRIVE_MCU (out, see main[1A], stspin32g4[6B]), INV_ENABLE (in, see main[1B]), INV_ENABLE_MCU (out, see main[1A], stspin32g4[6B]), OCP (out, see main[2B], stspin32g4[3B]), OV_ON (in, see main[2A], stspin32g4[4C]), VBUS (out, see main[2A], stspin32g4[3C]), VS1N (in, see main[1B]), VS1P (in, see main[1B]), VS2N (in, see main[1B]), VS2P (in, see main[1B]), VS3N (in, see main[1B]), VS3P (in, see main[1B])

### Nets
3V3: C23.2 C47.2 C60.1 C64.1 D14.2 R21.1 R24.1 R44.2 R45.2 R46.2 R69.2 R72.2 R73.2 R74.2 R75.2 U2.4(IN_TH) U6.1(VCC1) U11.5(VCC) U14.5(VCC)
3V3_A: C25.2 C27.2 C30.2 C31.2 C45.2 Q1.2(SOURCE) R55.1 U3.6(VS) U3.7(REF1) U4.6(VS) U4.7(REF1) U5.6(VS) U5.7(REF1) U7.6(VS) U7.7(REF1) U8.8(VCC+)
5V: L4.1
5V_EXT: C65.2 U6.8(VCC2)
5V_FAN: C58.2 Q2.3(DRAIN)
GND: C23.1 C24.1 C25.1 C26.1 C27.1 C28.1 C29.1 C30.1 C31.1 C36.1 C39.1 C42.1 C43.1 C44.1 C45.1 C46.1 C47.1 C48.1 C56.2 C57.1 C58.1 C59.1 C60.2 C61.2 C62.2 C63.2 C64.2 C71.2 D14.1 Q3.2(S) Q4.2(S) R36.1 R57.2 R60.2 R61.1 R66.2 R68.2 R78.2 TP4.1 U2.2(GND) U3.2(GND) U3.3(REF2) U4.2(GND) U4.3(REF2) U5.2(GND) U5.3(REF2) U6.4(GND1) U7.2(GND) U7.3(REF2) U8.6(VSS-) U8.9(EP) U11.2(GND) U14.2(GND) U15.5(E) U15.7(E) U17.5(E) U17.7(E)
GND_EXT: C65.1 D12.3 U6.5(GND2) U13.4(GND) U15.2(K) U15.4(K) U17.2(K) U17.4(K) U18.4(GND)
VCC: C48.2 U2.1(VCC)
VM_SENSE: R33.2 R58.2
BRAKE_ANALOG: U11.4(2Y) ; port BRAKE_ANALOG
BRAKE_ANALOG_IN: R83.1 U18.5(IO2) ; port BRAKE_ANALOG_IN
CAN_N: D12.2 R22.1 U6.6(CANL) ; port CAN_N
CAN_P: D12.1 R22.2 U6.7(CANH) ; port CAN_P
CAN_RX: D13.1(C) U6.3(RXD) ; port CAN_RX
CAN_TX: D11.1(C) U6.2(TXD) ; port CAN_TX
FAN_ON: R65.1 ; port FAN_ON
FAN_PWM: Q4.3(D) ; port FAN_PWM
FAN_PWM_ON: R67.1 ; port FAN_ON_PWM
FAN_TACHO: C59.2 R69.1 R70.2 ; port FAN_TACHO
FAN_TACHO_IN: R70.1 ; port FAN_TACHO_IN
GAS_ANALOG: U11.6(1Y) ; port GAS_ANALOG
GAS_ANALOG_IN: R82.1 U18.3(IO1) ; port GAS_ANALOG_IN
GOV: R62.1 R63.1 ; port GOV
HALL1_IN: R44.1 R47.1 ; port HALL1_IN
HALL2_IN: R45.1 R48.1 ; port HALL2_IN
HALL3_IN: R46.1 R49.1 ; port HALL3_IN
I_SENSE_A: C24.2 R23.2 ; port I_SENSE_A
I_SENSE_B: C26.2 R25.2 ; port I_SENSE_B
I_SENSE_C: C28.2 R26.2 ; port I_SENSE_C
IIN+: U5.8(IN+) ; port IN+
IIN-: U5.1(IN-) ; port IN-
INV_DRIVE_MCU: U14.4(2Y) ; port INV_DRIVE_MCU
INV_ENABLE_MCU: U14.6(1Y) ; port INV_ENABLE_MCU
OCP: C36.2 R28.1 R29.1 R30.1 ; port OCP
OV: D16.1(C) D17.1(C) R60.1 U2.3(IN)
OV_ON: D17.2(A) ; port OV_ON
SOA: R23.1 R28.2 U3.5(OUT)
SOB: R25.1 R29.2 U4.5(OUT)
SOC: R26.1 R30.2 U7.5(OUT)
VBUS: C39.2 D14.3 R35.2 ; port VBUS
VS1N: U3.1(IN-) ; port VS1N
VS1P: U3.8(IN+) ; port VS1P
VS2N: U4.1(IN-) ; port VS2N
VS2P: U4.8(IN+) ; port VS2P
VS3N: U7.1(IN-) ; port VS3N
VS3P: U7.8(IN+) ; port VS3P
NetC29_2: C29.2 R27.2 ; port I_SENSE_IN
NetC42_2: C42.2 R47.2 ; port HALL1
NetC43_2: C43.2 R48.2 ; port HALL2
NetC44_2: C44.2 R49.2 ; port HALL3
NetC46_2: C46.2 R59.1 R61.2 U8.2(IN-)
NetC56_1: C56.1 C57.2 L4.2 Q2.2(SOURCE) R64.1
NetC61_1: C61.1 R72.1 U11.3(2A) U17.6(C)
NetC62_1: C62.1 R75.1 U14.3(2A) U15.6(C)
NetC63_1: C63.1 R74.1 U14.1(1A) U15.8(C)
NetC71_1: C71.1 R73.1 U11.1(1A) U17.8(C)
NetD11_2: D11.2(A) R21.2
NetD13_2: D13.2(A) R24.2
NetD16_2: D16.2(A) Q1.3(DRAIN)
NetJ5_3: R76.1 U13.5(IO2) ; port INV_ENABLE
NetJ5_4: R77.1 U13.3(IO1) ; port INV_DRIVE
NetQ1_1: Q1.1(GATE) R56.2 U8.5(OUT)
NetQ2_1: Q2.1(GATE) Q3.3(D) R64.2 R78.1
NetQ3_1: Q3.1(G) R65.2 R66.1
NetQ4_1: Q4.1(G) R67.2 R68.1
NetR27_1: R27.1 U5.5(OUT)
NetR33_1: R33.1 R34.2
NetR34_1: R34.1 R35.1 R36.2 TP3.1
NetR55_2: R55.2 R56.1 R57.1 U8.3(IN+)
NetR58_1: R58.1 R59.2
NetR62_2: R62.2 U2.5(SNK)
NetR63_2: R63.2 U2.6(SRC)
NetR76_2: R76.2 U15.1(A)
NetR77_2: R77.2 U15.3(A)
NetR82_2: R82.2 U17.1(A)
NetR83_2: R83.2 U17.3(A)

Not connected (* = marked no-connect by the designer): U3 4(NC)*; U4 4(NC)*; U5 4(NC)*; U7 4(NC)*; U8 1(NC_1)* 4(NC_2)* 7(NC_3)*; U13 1(NC)* 2(NC)*; U18 1(NC)* 2(NC)*

### Layout directives
differential pair: CAN_N, CAN_P

### Notes on the sheet
- hall sensors RC filter & pull-up
- CAN interface